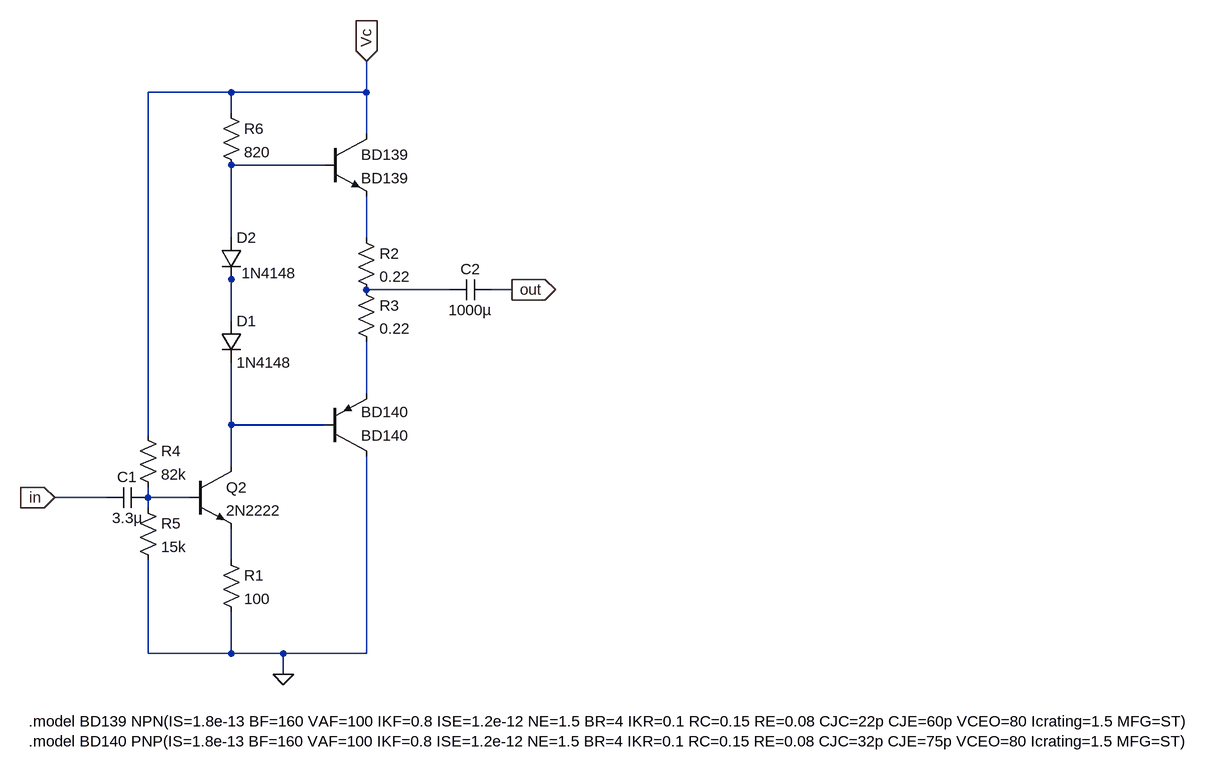
[diagram p0: schematic Power_Amplifier.asc]
Power_Amplifier.asc, the LTspice schematic file:
Version 4.1
SHEET 1 2296 1064
WIRE 96 32 -32 32
WIRE 304 32 304 -16
WIRE 304 32 96 32
WIRE 96 64 96 32
WIRE 304 96 304 32
WIRE 240 144 96 144
WIRE 96 256 96 144
WIRE 304 256 304 192
WIRE 96 320 96 304
WIRE 432 336 304 336
WIRE 528 336 496 336
WIRE 96 384 96 320
WIRE 304 496 304 416
WIRE 96 544 96 448
WIRE 240 544 96 544
WIRE -32 560 -32 32
WIRE 96 608 96 544
WIRE -96 656 -176 656
WIRE -32 656 -32 640
WIRE 32 656 -32 656
WIRE -32 672 -32 656
WIRE 96 752 96 704
WIRE -32 896 -32 752
WIRE 96 896 96 832
WIRE 96 896 -32 896
WIRE 176 896 96 896
WIRE 304 896 304 592
WIRE 304 896 176 896
WIRE 176 928 176 896
FLAG 176 928 0
FLAG -176 656 in
IOPIN -176 656 In
FLAG 528 336 out
IOPIN 528 336 Out
FLAG 304 -16 Vc
IOPIN 304 -16 In
SYMBOL npn 240 96 R0
SYMATTR InstName BD139
SYMATTR Value BD139
SYMBOL npn 32 608 R0
SYMATTR InstName Q2
SYMATTR Value 2N2222
SYMBOL pnp 240 592 M180
SYMATTR InstName BD140
SYMATTR Value BD140
SYMBOL res 80 736 R0
SYMATTR InstName R1
SYMATTR Value 100
SYMBOL diode 80 384 R0
SYMATTR InstName D1
SYMATTR Value 1N4148
SYMBOL diode 80 256 R0
WINDOW 3 32 54 Left 2
SYMATTR Value 1N4148
SYMATTR InstName D2
SYMBOL res 288 240 R0
SYMATTR InstName R2
SYMATTR Value 0.22
SYMBOL res 288 320 R0
SYMATTR InstName R3
SYMATTR Value 0.22
SYMBOL res -48 544 R0
SYMATTR InstName R4
SYMATTR Value 82k
SYMBOL res -48 656 R0
SYMATTR InstName R5
SYMATTR Value 15k
SYMBOL cap -32 640 R90
WINDOW 0 0 32 VBottom 2
WINDOW 3 32 32 VTop 2
SYMATTR InstName C1
SYMATTR Value 3.3µ
SYMBOL res 80 48 R0
SYMATTR InstName R6
SYMATTR Value 820
SYMBOL cap 496 320 R90
WINDOW 0 0 32 VBottom 2
WINDOW 3 32 32 VTop 2
SYMATTR InstName C2
SYMATTR Value 1000µ
TEXT -216 1000 Left 2 !.model BD139 NPN(IS=1.8e-13 BF=160 VAF=100 IKF=0.8 ISE=1.2e-12 NE=1.5 BR=4 IKR=0.1 RC=0.15 RE=0.08 CJC=22p CJE=60p VCEO=80 Icrating=1.5 MFG=ST)\n.model BD140 PNP(IS=1.8e-13 BF=160 VAF=100 IKF=0.8 ISE=1.2e-12 NE=1.5 BR=4 IKR=0.1 RC=0.15 RE=0.08 CJC=32p CJE=75p VCEO=80 Icrating=1.5 MFG=ST)

The netlist it stands for:
* Power_Amplifier.asc
Q§BD139 Vc N001 N002 0 BD139
Q2 N006 N007 N008 0 2N2222
Q§BD140 0 N006 N005 0 BD140
R1 N008 0 100
D1 N003 N006 1N4148
D2 N001 N003 1N4148
R2 N002 N004 0.22
R3 N004 N005 0.22
R4 Vc N007 82k
R5 N007 0 15k
C1 N007 in 3.3µ
R6 Vc N001 820
C2 out N004 1000µ
.model D D
.lib standard.dio
.model NPN NPN
.model PNP PNP
.lib standard.bjt
.model BD139 NPN(IS=1.8e-13 BF=160 VAF=100 IKF=0.8 ISE=1.2e-12 NE=1.5 BR=4 IKR=0.1 RC=0.15 RE=0.08 CJC=22p CJE=60p VCEO=80 Icrating=1.5 MFG=ST)
.model BD140 PNP(IS=1.8e-13 BF=160 VAF=100 IKF=0.8 ISE=1.2e-12 NE=1.5 BR=4 IKR=0.1 RC=0.15 RE=0.08 CJC=32p CJE=75p VCEO=80 Icrating=1.5 MFG=ST)
.backanno
.end